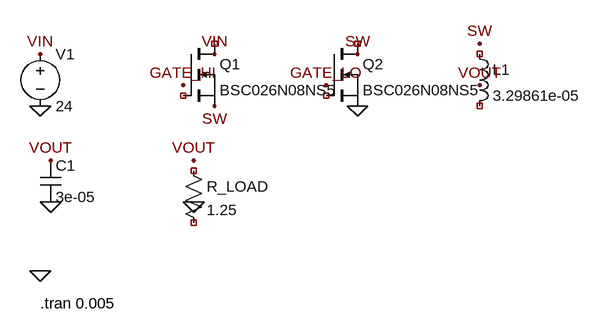
[diagram p0: schematic buck_schematic.asc]
buck_schematic.asc, the LTspice schematic file:
Version 4
SHEET 1 1400 900
SYMBOL voltage 100 100 R0
SYMATTR InstName V1
SYMATTR Value 24
FLAG 100 116 VIN
FLAG 100 196 0
SYMBOL nmos 320 100 R0
SYMATTR InstName Q1
SYMATTR Value BSC026N08NS5
FLAG 368 116 VIN
FLAG 320 164 GATE_HI
FLAG 368 196 SW
SYMBOL nmos 540 100 R0
SYMATTR InstName Q2
SYMATTR Value BSC026N08NS5
FLAG 588 116 SW
FLAG 540 164 GATE_LO
FLAG 588 196 0
SYMBOL ind 760 100 R0
SYMATTR InstName L1
SYMATTR Value 3.29861e-05
FLAG 776 100 SW
FLAG 776 164 VOUT
SYMBOL cap 100 280 R0
SYMATTR InstName C1
SYMATTR Value 3e-05
FLAG 116 280 VOUT
FLAG 116 344 0
SYMBOL res 320 280 R0
SYMATTR InstName R_LOAD
SYMATTR Value 1.25
FLAG 336 280 VOUT
FLAG 336 344 0
FLAG 100 450 0
TEXT 100 500 Left 2 !.tran 0.005

The netlist it stands for:
* buck_schematic.asc
V1 VIN 0 24
* Q1: BSC026N08NS5 (symbol nmos not certain, pin order unknown); nets seen at it: SW
* Q2: BSC026N08NS5 (symbol nmos not certain, pin order unknown); nets seen at it: 0
L1 NC_05 NC_06 3.29861e-05
C1 VOUT 0 3e-05
R_LOAD NC_07 NC_08 1.25
.tran 0.005
.backanno
.end